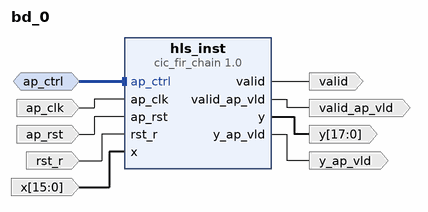
[diagram p0: block diagram of the top level]
# Vivado block design bd_0, xczu5eg-sfvc784-1-e, Vivado 2023.1
create_bd_design bd_0

create_bd_intf_port -mode Slave -vlnv xilinx.com:interface:acc_handshake_rtl:1.0 ap_ctrl
create_bd_port -dir I -type clk ap_clk
set_property -dict {CONFIG.FREQ_HZ 100000000.0} [get_bd_ports ap_clk]
create_bd_port -dir I -type rst ap_rst
set_property -dict {CONFIG.POLARITY ACTIVE_HIGH} [get_bd_ports ap_rst]
create_bd_port -dir I -type data rst_r
create_bd_port -dir O -type data valid
create_bd_port -dir O valid_ap_vld
create_bd_port -dir I -from 15 -to 0 -type data x
create_bd_port -dir O -from 17 -to 0 -type data y
create_bd_port -dir O y_ap_vld

create_bd_cell -type ip -vlnv xilinx.com:hls:cic_fir_chain:1.0 hls_inst

# ---- connections ----

connect_bd_intf_net -intf_net ap_ctrl_0_1 [get_bd_intf_ports ap_ctrl] [get_bd_intf_pins hls_inst/ap_ctrl]
connect_bd_net -net ap_clk_0_1 [get_bd_ports ap_clk] [get_bd_pins hls_inst/ap_clk]
connect_bd_net -net ap_rst_0_1 [get_bd_ports ap_rst] [get_bd_pins hls_inst/ap_rst]
connect_bd_net [get_bd_pins hls_inst/valid] [get_bd_ports valid]
connect_bd_net [get_bd_pins hls_inst/valid_ap_vld] [get_bd_ports valid_ap_vld]
connect_bd_net [get_bd_pins hls_inst/y] [get_bd_ports y]
connect_bd_net [get_bd_pins hls_inst/y_ap_vld] [get_bd_ports y_ap_vld]
connect_bd_net -net rst_r_0_1 [get_bd_ports rst_r] [get_bd_pins hls_inst/rst_r]
connect_bd_net -net x_0_1 [get_bd_ports x] [get_bd_pins hls_inst/x]

validate_bd_design
save_bd_design
